# Altium schematic sheet Micromouse.SchDoc
size A
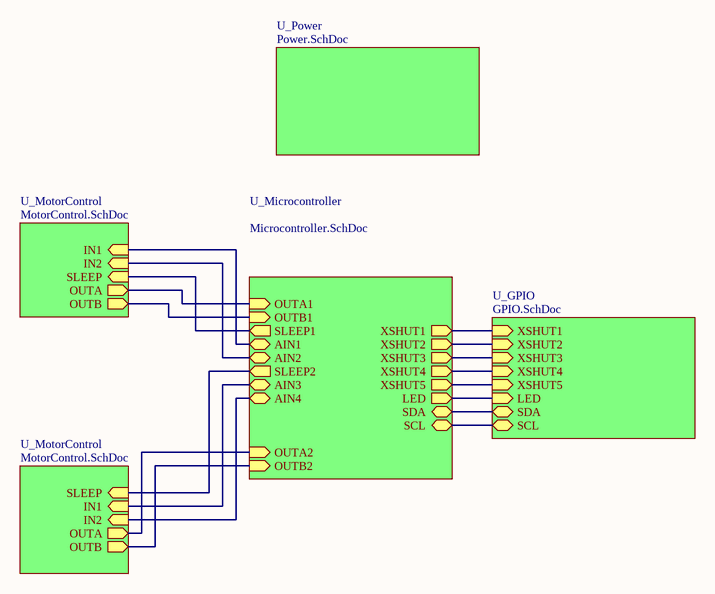
[diagram p0: Micromouse.SchDoc]

## Sub-sheets
U_GPIO = GPIO.SchDoc: XSHUT1 (in), XSHUT2 (in), XSHUT3 (in), XSHUT4 (in), XSHUT5 (in), LED (in), SCL (bidir), SDA (bidir)
U_Microcontroller = Microcontroller.SchDoc: XSHUT2 (out), AIN3 (bidir), AIN4 (bidir), SDA (bidir), SCL (bidir), AIN2 (bidir), AIN1 (bidir), XSHUT1 (out), XSHUT3 (out), XSHUT4 (out), XSHUT5 (out), LED (out), OUTA1 (in), OUTB1 (in), OUTB2 (in), OUTA2 (in), SLEEP1 (out), SLEEP2 (out)
U_MotorControl = MotorControl.SchDoc: IN2 (in), SLEEP (in), IN1 (in), OUTA (out), OUTB (out)
U_MotorControl = MotorControl.SchDoc: IN2 (in), IN1 (in), SLEEP (in), OUTA (out), OUTB (out)
U_Power = Power.SchDoc: no entries

## Nets
(unnamed): sheet U_GPIO/XSHUT1, sheet U_Microcontroller/XSHUT1
(unnamed): sheet U_GPIO/XSHUT2, sheet U_Microcontroller/XSHUT2
(unnamed): sheet U_GPIO/XSHUT3, sheet U_Microcontroller/XSHUT3
(unnamed): sheet U_GPIO/XSHUT4, sheet U_Microcontroller/XSHUT4
(unnamed): sheet U_GPIO/XSHUT5, sheet U_Microcontroller/XSHUT5
(unnamed): sheet U_GPIO/LED, sheet U_Microcontroller/LED
(unnamed): sheet U_GPIO/SCL, sheet U_Microcontroller/SCL
(unnamed): sheet U_GPIO/SDA, sheet U_Microcontroller/SDA
(unnamed): sheet U_Microcontroller/AIN3, sheet U_MotorControl/IN1
(unnamed): sheet U_Microcontroller/AIN4, sheet U_MotorControl/IN2
(unnamed): sheet U_Microcontroller/AIN2, sheet U_MotorControl/IN2
(unnamed): sheet U_Microcontroller/AIN1, sheet U_MotorControl/IN1
(unnamed): sheet U_Microcontroller/OUTA1, sheet U_MotorControl/OUTA
(unnamed): sheet U_Microcontroller/OUTB1, sheet U_MotorControl/OUTB
(unnamed): sheet U_Microcontroller/OUTB2, sheet U_MotorControl/OUTB
(unnamed): sheet U_Microcontroller/OUTA2, sheet U_MotorControl/OUTA
(unnamed): sheet U_Microcontroller/SLEEP1, sheet U_MotorControl/SLEEP
(unnamed): sheet U_Microcontroller/SLEEP2, sheet U_MotorControl/SLEEP